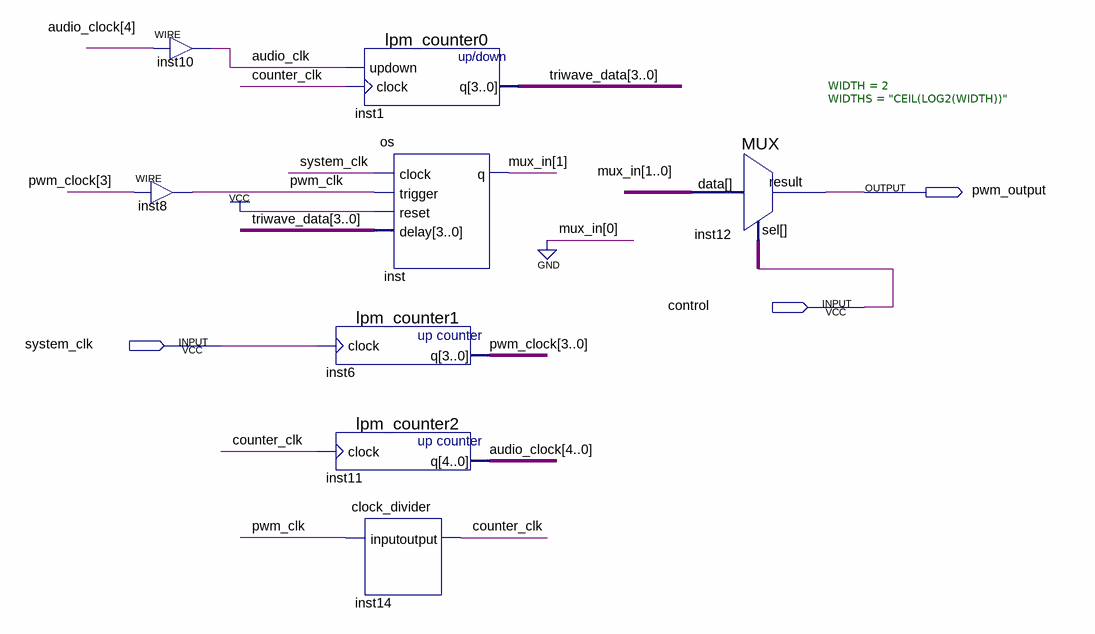
[diagram p0: schematic sheet]
// Quartus schematic pwm_sinewave.bdf as structural Verilog: 8 symbols, 3 pins
module pwm_sinewave (
  input  control,
  input  system_clk,
  output pwm_output
);

  wire audio_clk, counter_clk, pwm_clk, undriven;
  wire [1:1] mux_in;
  wire [3:0] pwm_clock, triwave_data;
  wire [4:0] audio_clock;

  assign pwm_clk = pwm_clock[3];  // WIRE inst8
  assign audio_clk = audio_clock[4];  // WIRE inst10
  lpm_counter0 inst1 (.updown(audio_clk), .clock(counter_clk), .q(triwave_data));
  os inst (.clock(system_clk), .trigger(pwm_clk), .reset(1'b1), .delay(triwave_data), .q(mux_in[1]));
  lpm_counter1 inst6 (.clock(system_clk), .q(pwm_clock));
  lpm_counter2 inst11 (.clock(counter_clk), .q(audio_clock));
  clock_divider inst14 (.\input (pwm_clk), .\output (counter_clk));
  MUX #(.WIDTH(2), .WIDTHS("CEIL(LOG2(WIDTH))")) inst12 (.data({mux_in[1], 1'b0}), .sel(undriven), .result(pwm_output));
endmodule
